# Altium project ads129x_Demoboard.PrjPcb
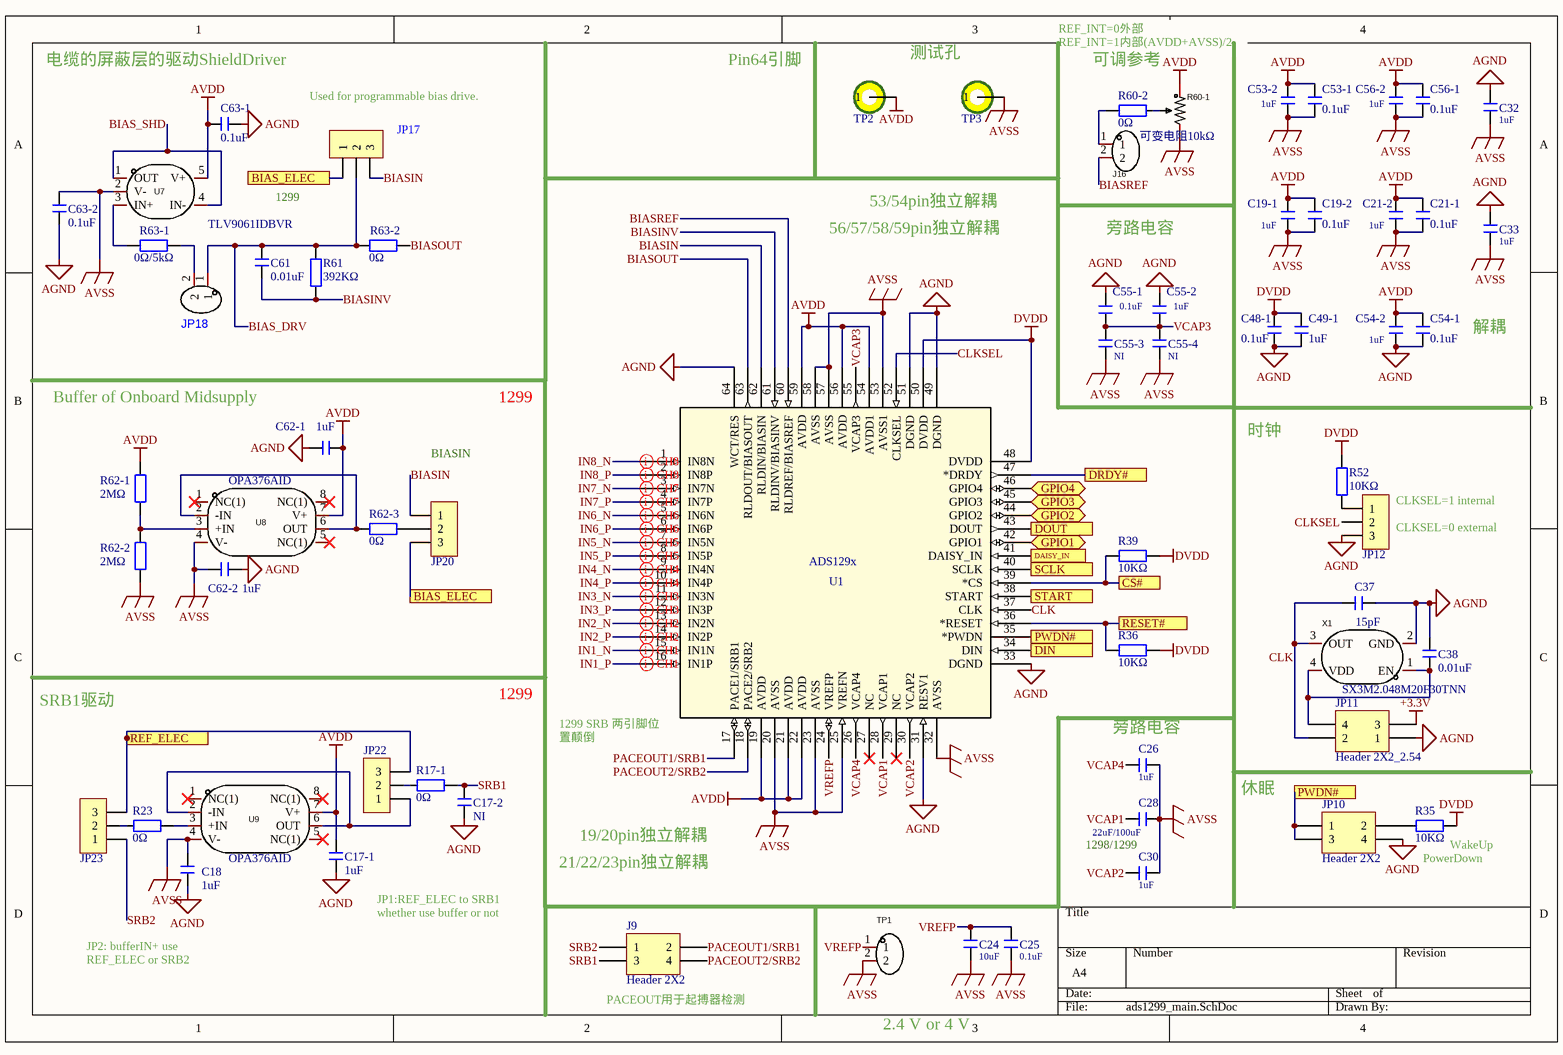
[diagram p0: ads1299_main.SchDoc]
4 sheets, 175 parts. Net scope: global (net labels, ports and power ports of the same name join across sheets).
Board file: ads1299.PcbDoc
Sheets:
  ads1299_main.SchDoc
  ads1299_Regulators.SchDoc
  ads1299_Ain.SchDoc
  ads1299_Interface.SchDoc

## Sheet ads1299_main.SchDoc
size A4

### Parts
C17-1  1uF  [0603C]
C17-2  NI  [0603C]
C18  1uF  [0603C]
C19-1  1uF  [0603C]
C19-2  0.1uF  [0603C]
C21-1  0.1uF  [0603C]
C21-2  1uF  [0603C]
C24  10uF  [0603C]
C25  0.1uF  [0603C]
C26  1uF  [0603C]
C28  22uF/100uF  [0603C]
C30  1uF  [0603C]
C32  1uF  [0603C]
C33  1uF  [0603C]
C37  15pF  [0603C]
C38  0.01uF  [0603C]
C48-1  0.1uF  [0603C]
C49-1  1uF  [0603C]
C53-1  0.1uF  [0603C]
C53-2  1uF  [0603C]
C54-1  0.1uF  [0603C]
C54-2  1uF  [0603C]
C55-1  0.1uF  [0603C]
C55-2  1uF  [0603C]
C55-3  NI  [0603C]
C55-4  NI  [0603C]
C56-1  0.1uF  [0603C]
C56-2  1uF  [0603C]
C61  0.01uF  [0603C]
C62-1  1uF  [0603C]
C62-2  1uF  [0603C]
C63-1  0.1uF  [0603C]
C63-2  0.1uF  [0603C]
J9  Header 2X2  [HDR2.54-LI-2x2P]
J16  Header_2P_2.54  [HDR2.54-LI-2P]  (value not drawn)
JP10  Header 2X2  [HDR2.54-LI-2x2P]
JP11  Header 2X2_2.54  [HDR2.54-LI-2x2P]
JP12  HDR-1X3  [HDR2.54-LI-3P]  (value not drawn)
JP17  HDR-1X3  [HDR2.54-LI-3P]  (value not drawn)
JP18  Header_2P_2.54  [HDR2.54-LI-2P]  (value not drawn)
JP20  HDR-1X3  [HDR2.54-LI-3P]  (value not drawn)
JP22  HDR-1X3  [HDR2.54-LI-3P]  (value not drawn)
JP23  HDR-1X3  [HDR2.54-LI-3P]  (value not drawn)
R17-1  0Ω  [0603R]
R23  0Ω  [0603R]
R35  10KΩ  [0603R]
R36  10KΩ  [0603R]
R39  10KΩ  [0603R]
R52  10KΩ  [0603R]
R60-1  可变电阻10kΩ  [RES-ADJ-TH_3362P]
R60-2  0Ω  [0603R]
R61  392KΩ  [0603R]
R62-1  2MΩ  [0603R]
R62-2  2MΩ  [0603R]
R62-3  0Ω  [0603R]
R63-1  0Ω/5kΩ  [0603R]
R63-2  0Ω  [0603R]
TP1  Header_2P_2.54  [HDR2.54-LI-2P]  (value not drawn)
TP2  测试点  [TestPoint_Pad]  (value not drawn)
TP3  测试点  [TestPoint_Pad]  (value not drawn)
U1  ADS129x  [LQFP-64]
U7  TLV9061IDBVR  [SOT23-5]
U8  OPA376AID  [SOIC-8]
U9  OPA376AID  [SOIC-8]
X1  SX3M2.048M20F30TNN  [OSC 3225-4P]

### Ports
BIAS_ELEC, CS#, DAISY_IN, DIN, DOUT, DRDY#, GPIO1 (bidir), GPIO2 (bidir), GPIO3 (bidir), GPIO4 (bidir), PWDN#, REF_ELEC, RESET#, SCLK, START

### Nets
+3.3V: JP11.3
AGND: C17-1.1 C17-2.1 C18.2 C32.1 C33.1 C37.1 C38.2 C48-1.1 C49-1.1 C54-1.1 C54-2.1 C55-1.1 C55-2.1 C62-1.1 C62-2.2 C63-1.1 C63-2.2 JP10.4 JP11.1 JP12.3 U1.31(RESV1) U1.33(DGND) U1.49(DGND) U1.51(DGND) U1.64(WCT/RES) X1.2(GND)
AVDD: C17-1.2 C19-1.2 C19-2.2 C21-1.2 C21-2.2 C53-1.2 C53-2.2 C54-1.2 C54-2.2 C56-1.2 C56-2.2 C62-1.2 C63-1.2 R60-1.1 R62-1.2 TP2.1 U1.19(AVDD) U1.21(AVDD) U1.22(AVDD) U1.54(AVDD1) U1.56(AVDD) U1.59(AVDD) U7.5(V+) U8.7(V+) U9.7(V+)
AVSS: C18.1 C19-1.1 C19-2.1 C21-1.1 C21-2.1 C24.2 C25.1 C26.1 C28.1 C30.1 C32.2 C33.2 C53-1.1 C53-2.1 C55-3.2 C55-4.2 C56-1.1 C56-2.1 C62-2.1 C63-2.1 R60-1.3 R62-2.1 TP1.2 TP3.1 U1.20(AVSS) U1.23(AVSS) U1.25(VREFN) U1.32(AVSS) U1.53(AVSS1) U1.57(AVSS) U1.58(AVSS) U7.2(V-) U8.4(V-) U9.4(V-)
DVDD: C48-1.2 C49-1.2 R35.1 R36.2 R39.1 R52.2 U1.48(DVDD) U1.50(DVDD)
BIAS_DRV: C61.1 JP17.2 JP18.1 R61.2 R63-2.2
BIAS_ELEC: JP17.1 JP20.3 ; port BIAS_ELEC
BIAS_SHD: U7.1(OUT) U7.4(IN-)
BIASIN: JP17.3 JP20.1 U1.62(RLDIN/BIASIN)
BIASINV: C61.2 R61.1 U1.61(RLDINV/BIASINV)
BIASOUT: R63-2.1 U1.63(RLDOUT/BIASOUT)
BIASREF: J16.2 U1.60(RLDREF/BIASREF)
CLK: C37.2 JP11.2 U1.37(CLK) X1.3(OUT)
CLKSEL: JP12.2 U1.52(CLKSEL)
CS#: R39.2 U1.39(*CS) ; port CS#
DAISY_IN: U1.41(DAISY_IN) ; port DAISY_IN
DIN: U1.34(DIN) ; port DIN
DOUT: U1.43(DOUT) ; port DOUT
DRDY#: U1.47(*DRDY) ; port DRDY#
GPIO1: U1.42(GPIO1) ; port GPIO1
GPIO2: U1.44(GPIO2) ; port GPIO2
GPIO3: U1.45(GPIO3) ; port GPIO3
GPIO4: U1.46(GPIO4) ; port GPIO4
IN1_N: U1.15(IN1N)
IN1_P: U1.16(IN1P)
IN2_N: U1.13(IN2N)
IN2_P: U1.14(IN2P)
IN3_N: U1.11(IN3N)
IN3_P: U1.12(IN3P)
IN4_N: U1.9(IN4N)
IN4_P: U1.10(IN4P)
IN5_N: U1.7(IN5N)
IN5_P: U1.8(IN5P)
IN6_N: U1.5(IN6N)
IN6_P: U1.6(IN6P)
IN7_N: U1.3(IN7N)
IN7_P: U1.4(IN7P)
IN8_N: U1.1(IN8N)
IN8_P: U1.2(IN8P)
PACEOUT1/SRB1: J9.2 U1.17(PACE1/SRB1)
PACEOUT2/SRB2: J9.4 U1.18(PACE2/SRB2)
PWDN#: JP10.1 JP10.3 U1.35(*PWDN) ; port PWDN#
REF_ELEC: JP22.3 JP23.3 ; port REF_ELEC
RESET#: R36.1 U1.36(*RESET) ; port RESET#
SCLK: U1.40(SCLK) ; port SCLK
SRB1: C17-2.2 J9.3 R17-1.2
SRB2: J9.1 JP23.1
START: U1.38(START) ; port START
VCAP1: C28.2 U1.28(VCAP1)
VCAP2: C30.2 U1.30(VCAP2)
VCAP3: C55-1.2 C55-2.2 C55-3.1 C55-4.1 U1.55(VCAP3)
VCAP4: C26.2 U1.26(VCAP4)
VREFP: C24.1 C25.2 TP1.1 U1.24(VREFP)
NetC38_1: C38.1 JP11.4 X1.1(EN) X1.4(VDD)
NetJ16_1: J16.1 R60-2.2
NetJP10_2: JP10.2 R35.2
NetJP12_1: JP12.1 R52.1
NetJP18_2: JP18.2 R63-1.2
NetJP20_2: JP20.2 R62-3.2
NetJP22_1: JP22.1 U9.2(-IN) U9.6(OUT)
NetJP22_2: JP22.2 R17-1.1
NetJP23_2: JP23.2 R23.1
NetR23_2: R23.2 U9.3(+IN)
NetR60-1_2: R60-1.2 R60-2.1
NetR62-1_1: R62-1.1 R62-2.2 U8.3(+IN)
NetR62-3_1: R62-3.1 U8.2(-IN) U8.6(OUT)
NetR63-1_1: R63-1.1 U7.3(IN+)

Not connected (* = marked no-connect by the designer): U1 27(NC)* 29(NC)*; U8 1(NC(1))* 5(NC(1))* 8(NC(1))*; U9 1(NC(1))* 5(NC(1))* 8(NC(1))*

### Layout directives
differential pair: IN1_N, IN1_P, IN2_N, IN2_P, IN3_N, IN3_P, IN4_N, IN4_P, IN5_N, IN5_P, IN6_N, IN6_P, IN7_N, IN7_P, IN8_N, IN8_P

### Notes on the sheet
- REF_INT=0外部
  REF_INT=1内部(AVDD+AVSS)/2
- 电缆的屏蔽层的驱动ShieldDriver
- Used for programmable bias drive.
- Pin64引脚
- 测试孔
- 可调参考
- 1299
- 56/57/58/59pin独立解耦
- 53/54pin独立解耦
- 旁路电容
- 解耦
- Buffer of Onboard Midsupply
- BIASIN
- 时钟
- (near JP12) CLKSEL=0 external
- CLKSEL=1 internal
- SRB1驱动
- (near U1) 1299 SRB 两引脚位置颠倒
- (near C26) 旁路电容
- 休眠
- 19/20pin独立解耦
- 1298/1299
- (near R35) PowerDown
- (near R35) WakeUp
- (near C17-1) JP1:REF_ELEC to SRB1
  whether use buffer or not
- 21/22/23pin独立解耦
- JP2: bufferIN+ use
  REF_ELEC or SRB2
- (near J9) PACEOUT用于起搏器检测
- 2.4 V or 4 V

### Library data of the parts
C17-1 C17-2 C18 C19-1 C19-2 C21-1 C21-2 C24-C26 C28 C30 C32 C33 C37 C38 C48-1 C49-1 C53-1 C53-2 C54-1 C54-2 C55-1-C55-4 C56-1 C56-2 C61 C62-1 C62-2 C63-1 C63-2 = C: Chip  Ceramic Capacitor; BOM名称: 无极性贴片电容; 版权归属: 源创客; 学习资源: www.ooocke.com
J9 JP10 = Header 2X2: Header, 2-Pin, Dual row; LatestRevisionDate: 17-Jul-2002; LatestRevisionNote: Re-released for DXP Platform.; Publisher: Altium Limited
J16 JP18 TP1 = Header_2P_2.54: Manufacturer: MOLEX; Name: 22284020; Add into BOM: yes; Pitch: 2.54mm; Pin Structure: 1x2P; Circluar Pins/Square Pins: 方针; Symbol: 22-28-4020; Device: 22284020; LCSC Part Name: 2.54mm 1x2P 直插 方针; Supplier Part: C234182; Manufacturer Part: 22284020; Supplier Footprint: 直插,P=2.54mm; JLCPCB Part Class: Extended Part; Datasheet: https://atta.szlcsc.com/upload/public/pdf/source/20180801/C234182_F77B1C2A9EF8AC9B34CEB7670B45930E.pdf; Supplier: LCSC; Convert to PCB: yes; Number of Pins: 2; Number of Rows: 1; Row Spacing: -; Mounting Type: 直插; Current Rating (Max): -; Voltage Rating (Max): -; Length of Mating Pin: -; Insulation Height: -; Contact Material: 黄铜; Contact Plating: -; Color: 黑色
JP11 = Header 2X2_2.54: Header, 2-Pin, Dual row; LatestRevisionDate: 17-Jul-2002; LatestRevisionNote: Re-released for DXP Platform.; Publisher: Altium Limited
JP12 JP17 JP20 JP22 JP23 = Header 3: 3P接插件; 版权归属: 源创客; BOM名称: 3P接插件; 学习资源: www.ooocke.com
R17-1 R23 R35 R36 R39 R52 R60-2 R61 R62-1-R62-3 R63-1 R63-2 = R: 贴片电阻; 版权归属: 源创客; BOM名称: 贴片电阻; 学习资源: www.ooocke.com
R60-1 = 3362P-1-103: Manufacturer: BOCHEN(博晨); Name: 10kΩ; Symbol: 3362P-1-103_C118956; Add into BOM: yes; Value: 10kΩ; Tolerance: ±10%; Device: 3362P-1-103; LCSC Part Name: 10kΩ ±10%; Supplier Part: C118956; Manufacturer Part: 3362P-1-103; Supplier Footprint: 插件; JLCPCB Part Class: Extended Part; Datasheet: https://atta.szlcsc.com/upload/public/pdf/source/20171114/C118956_15106326650691117445.pdf; Supplier: LCSC; Convert to PCB: yes
TP2 TP3 = TestPoint
U1 = ADS129x: ECG,EEG; Mfr_Name: Texas Instruments; Manufacturer_Part_Number: ADS131E08SPAG; Copyright: Copyright (C) 2022 Ultra Librarian. All rights reserved.; RefDes: RefDes; Type: DEV
U7 = TLV9061IDBVR: Manufacturer: TI(德州仪器); Add into BOM: yes; Name: TLV9061IDBVR; Symbol: TLV9061IDBVR; Device: TLV9061IDBVR; LCSC Part Name: TLV9061IDBVR; Supplier Part: C398358; Manufacturer Part: TLV9061IDBVR; Supplier Footprint: SOT-23-5; JLCPCB Part Class: Extended Part; Datasheet: https://atta.szlcsc.com/upload/public/pdf/source/20190614/C398358_49FE9762020E71441728160F646E231F.pdf; Supplier: LCSC; Convert to PCB: yes; Amplifier Type: -; Number of Circuits: -; -3db Bandwidth（G=1）: -; Current - Input Bias（Ib）: -; Voltage - Input Offset（Vos）: -; Gain Bandwidth Product（GBP）: -; Slew Rate（SR）: -; Output Type: -; Supply Voltage（Single）: -; Iq per channel (Typ): -; Operating Temperature: -
U8 U9 = OPA376AID: Manufacturer: TI(德州仪器); Add into BOM: yes; Name: OPA376AID; Symbol: OPA376AID; Device: OPA376AID; LCSC Part Name: OPA376AID; Supplier Part: C1347528; Manufacturer Part: OPA376AID; Supplier Footprint: SOIC-8; JLCPCB Part Class: Extended Part; Datasheet: https://atta.szlcsc.com/upload/public/pdf/source/20210701/9FC12D00E1332600214DE3C63939EFF5.pdf; Supplier: LCSC; Convert to PCB: yes
X1 = SX3M2.048M20F30TNN: Manufacturer: SCTF(星通时频); Name: 2.048MHz; Add into BOM: yes; Value: 2.048MHz; Frequency Stability: ±20ppm; Supply Voltage: 1.62V~3.63V; Supply Current (Max): 10mA; Output Type: CMOS; Symbol: SX3M2.048M20F30TNN; Device: SX3M2.048M20F30TNN; LCSC Part Name: 2.048MHz ±20ppm 1.62V~3.63V CMOS; Supplier Part: C2901549; Manufacturer Part: SX3M2.048M20F30TNN; Supplier Footprint: SMD3225-4P; JLCPCB Part Class: Extended Part; Datasheet: https://atta.szlcsc.com/upload/public/pdf/source/20211009/2941C931EA31459006A6A1B668A18381.pdf; Supplier: LCSC; Convert to PCB: yes; Operating Temperature: -40℃~+85℃

## Sheet ads1299_Regulators.SchDoc
size A4
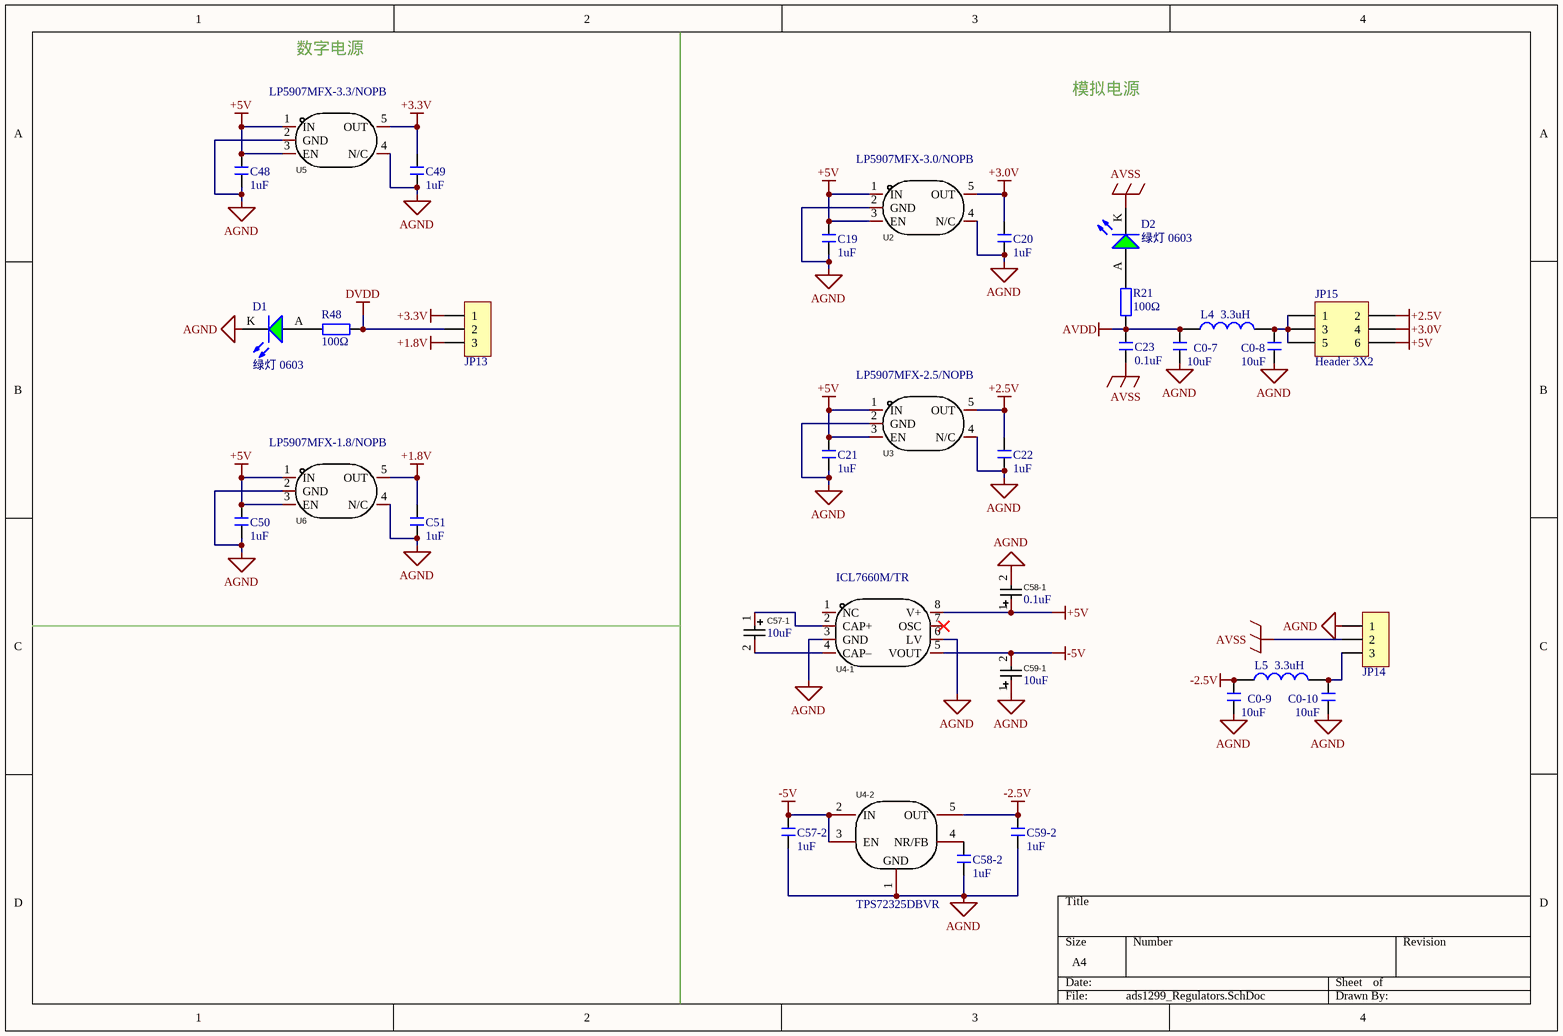
[diagram p1: ads1299_Regulators.SchDoc]

### Parts
C0-7  10uF  [0603C]
C0-8  10uF  [0603C]
C0-9  10uF  [0603C]
C0-10  10uF  [0603C]
C19  1uF  [0603C]
C20  1uF  [0603C]
C21  1uF  [0603C]
C22  1uF  [0603C]
C23  0.1uF  [0603C]
C48  1uF  [0603C]
C49  1uF  [0603C]
C50  1uF  [0603C]
C51  1uF  [0603C]
C57-1  10uF  [Tantalum_cap]
C57-2  1uF  [0603C]
C58-1  0.1uF  [Tantalum_cap]
C58-2  1uF  [0603C]
C59-1  10uF  [Tantalum_cap]
C59-2  1uF  [0603C]
D1  绿灯 0603  [LED 0603G]
D2  绿灯 0603  [LED 0603G]
JP13  HDR-1X3  [HDR2.54-LI-3P]  (value not drawn)
JP14  HDR-1X3  [HDR2.54-LI-3P]  (value not drawn)
JP15  Header 3X2  [HDR2.54-LI-2x3P]
L4  3.3uH  [L 1206]
L5  3.3uH  [L 1206]
R21  100Ω  [0603R]
R48  100Ω  [0603R]
U2  LP5907MFX-3.0/NOPB  [SOT23-5]
U3  LP5907MFX-2.5/NOPB  [SOT23-5]
U4-1  ICL7660M/TR  [SOIC-8]
U4-2  TPS72325DBVR  [SOT23-5]
U5  LP5907MFX-3.3/NOPB  [SOT23-5]
U6  LP5907MFX-1.8/NOPB  [SOT23-5]

### Nets
+1.8V: C51.2 JP13.3 U6.5(OUT)
+2.5V: C22.2 JP15.2 U3.5(OUT)
+3.0V: C20.2 JP15.4 U2.5(OUT)
+3.3V: C49.2 JP13.1 U5.5(OUT)
+5V: C19.2 C21.2 C48.2 C50.2 C58-1.1 JP15.6 U2.1(IN) U2.3(EN) U3.1(IN) U3.3(EN) U4-1.8(V+) U5.1(IN) U5.3(EN) U6.1(IN) U6.3(EN)
-2.5V: C0-9.2 C59-2.2 L5.1 U4-2.5(OUT)
-5V: C57-2.2 C59-1.2 U4-1.5(VOUT) U4-2.2(IN) U4-2.3(EN)
AGND: C0-7.1 C0-8.1 C0-9.1 C0-10.1 C19.1 C20.1 C21.1 C22.1 C48.1 C49.1 C50.1 C51.1 C57-2.1 C58-1.2 C58-2.1 C59-1.1 C59-2.1 D1.K JP14.1 U2.2(GND) U2.4(N/C) U3.2(GND) U3.4(N/C) U4-1.3(GND) U4-1.6(LV) U4-2.1(GND) U5.2(GND) U5.4(N/C) U6.2(GND) U6.4(N/C)
AVDD: C0-7.2 C23.2 L4.1 R21.2
AVSS: C23.1 D2.K JP14.2
DVDD: JP13.2 R48.2
NetC0-8_2: C0-8.2 JP15.1 JP15.3 JP15.5 L4.2
NetC0-10_2: C0-10.2 JP14.3 L5.2
NetC57-1_1: C57-1.1 U4-1.2(CAP+)
NetC57-1_2: C57-1.2 U4-1.4(CAP–)
NetC58-2_2: C58-2.2 U4-2.4(NR/FB)
NetD1_A: D1.A R48.1
NetD2_A: D2.A R21.1

Not connected (* = marked no-connect by the designer): U4-1 1(NC) 7(OSC)*

### Notes on the sheet
- 数字电源
- 模拟电源

### Library data of the parts
C0-7-C0-10 C19-C23 C48-C51 C57-2 C58-2 C59-2 = C: as C17-1 on sheet ads1299_main; 学习资源: www.ooocke.com
C57-1 C58-1 C59-1 = Tantalum_cap: Manufacturer: Kyocera AVX; Name: 1uF; Symbol: TAJA105K035RNJ; Add into BOM: yes; Value: 1uF; Tolerance: ±10%; Rated Voltage: 35V; Equivalent Series Resistance(ESR): 7.5Ω@100kHz; Device: TAJA105K035RNJ; LCSC Part Name: 1uF ±10% 35V; Supplier Part: C7176; Manufacturer Part: TAJA105K035RNJ; Supplier Footprint: CASE-A_3216; JLCPCB Part Class: Extended Part; Datasheet: https://atta.szlcsc.com/upload/public/pdf/source/20160107/1457707748301.pdf; Supplier: LCSC; Convert to PCB: yes; Operating Temperature: -55℃~+125℃
D1 D2 = 0603 绿灯: 发光二极管; ComponentLink1Description: 供应商链接; ComponentLink1URL: http://www.szlcsc.com/product/details_73152.html; Package: 0603; Supplier: LC; SuppliersPartNumber: C72043
JP13 JP14 = Header 3: 3P接插件; 版权归属: 源创客; BOM名称: 3P接插件; 学习资源: www.ooocke.com
JP15 = Header 3X2: Header, 3-Pin, Dual row; LatestRevisionDate: 17-Jul-2002; LatestRevisionNote: Re-released for DXP Platform.; Publisher: Altium Limited
L4 L5 = L 1206: 小功率贴片电感; 版权归属: 源创客; BOM名称: 小功率贴片电感; 学习资源: www.ooocke.com
R21 R48 = R: 贴片电阻; 版权归属: 源创客; BOM名称: 贴片电阻; 学习资源: www.ooocke.com
U2 U3 U5 U6 = LP5907MFX-3.3/NOPB: Manufacturer: TI(德州仪器); Add into BOM: yes; Output Type: 固定; Output Polarity: 正; Number of Outputs: 1; Maximum Input Voltage: 5.5V; Output Voltage: 3.3V; Dropout Voltage: 250mV@(250mA); Output Current: 250mA; Power Supply Rejection Ratio (PRSS): 90dB@(100Hz),60dB@(100kHz); Name: LP5907MFX-3.3/NOPB; Symbol: LP5907MFX-3.3/NOPB; Device: LP5907MFX-3.3/NOPB; LCSC Part Name: Vin=5.5V Vout=3.3V 250mA 90dB@(100Hz),60dB@(100kHz); Supplier Part: C80670; Manufacturer Part: LP5907MFX-3.3/NOPB; Supplier Footprint: SOT-23-5; JLCPCB Part Class: Extended Part; Datasheet: https://atta.szlcsc.com/upload/public/pdf/source/20160830/1472551528598.pdf; Supplier: LCSC; Convert to PCB: yes
U4-1 = ICL7660M/TR: Manufacturer: HGSEMI(华冠); Add into BOM: yes; Name: ICL7660M/TR; Symbol: ICL7660M/TR; Device: ICL7660M/TR; LCSC Part Name: ICL7660M/TR; Supplier Part: C356724; Manufacturer Part: ICL7660M/TR; Supplier Footprint: SOP-8; JLCPCB Part Class: Extended Part; Datasheet: https://atta.szlcsc.com/upload/public/pdf/source/20220223/B7DC69E53F1DD57A8AF8717E7604F527.pdf; Supplier: LCSC; Convert to PCB: yes
U4-2 = TPS72325DBVR: Manufacturer: TI(德州仪器); Add into BOM: yes; Output Type: 固定; Output Polarity: 负; Number of Outputs: 1; Maximum Input Voltage: 10V; Output Voltage: 2.5V; Dropout Voltage: 500mV@(200mA); Output Current: 200mA; Power Supply Rejection Ratio (PSRR): 65dB; Name: TPS72325DBVR; Symbol: TPS72325DBVR; Device: TPS72325DBVR; LCSC Part Name: 负 Vin=10V Vout=2.5V 200mA 65dB; Supplier Part: C69932; Manufacturer Part: TPS72325DBVR; Supplier Footprint: SOT-23-5; JLCPCB Part Class: Extended Part; Datasheet: https://atta.szlcsc.com/upload/public/pdf/source/20171113/C69932_15105675558771116637.pdf; Supplier: LCSC; Convert to PCB: yes

## Sheet ads1299_Ain.SchDoc
size A4
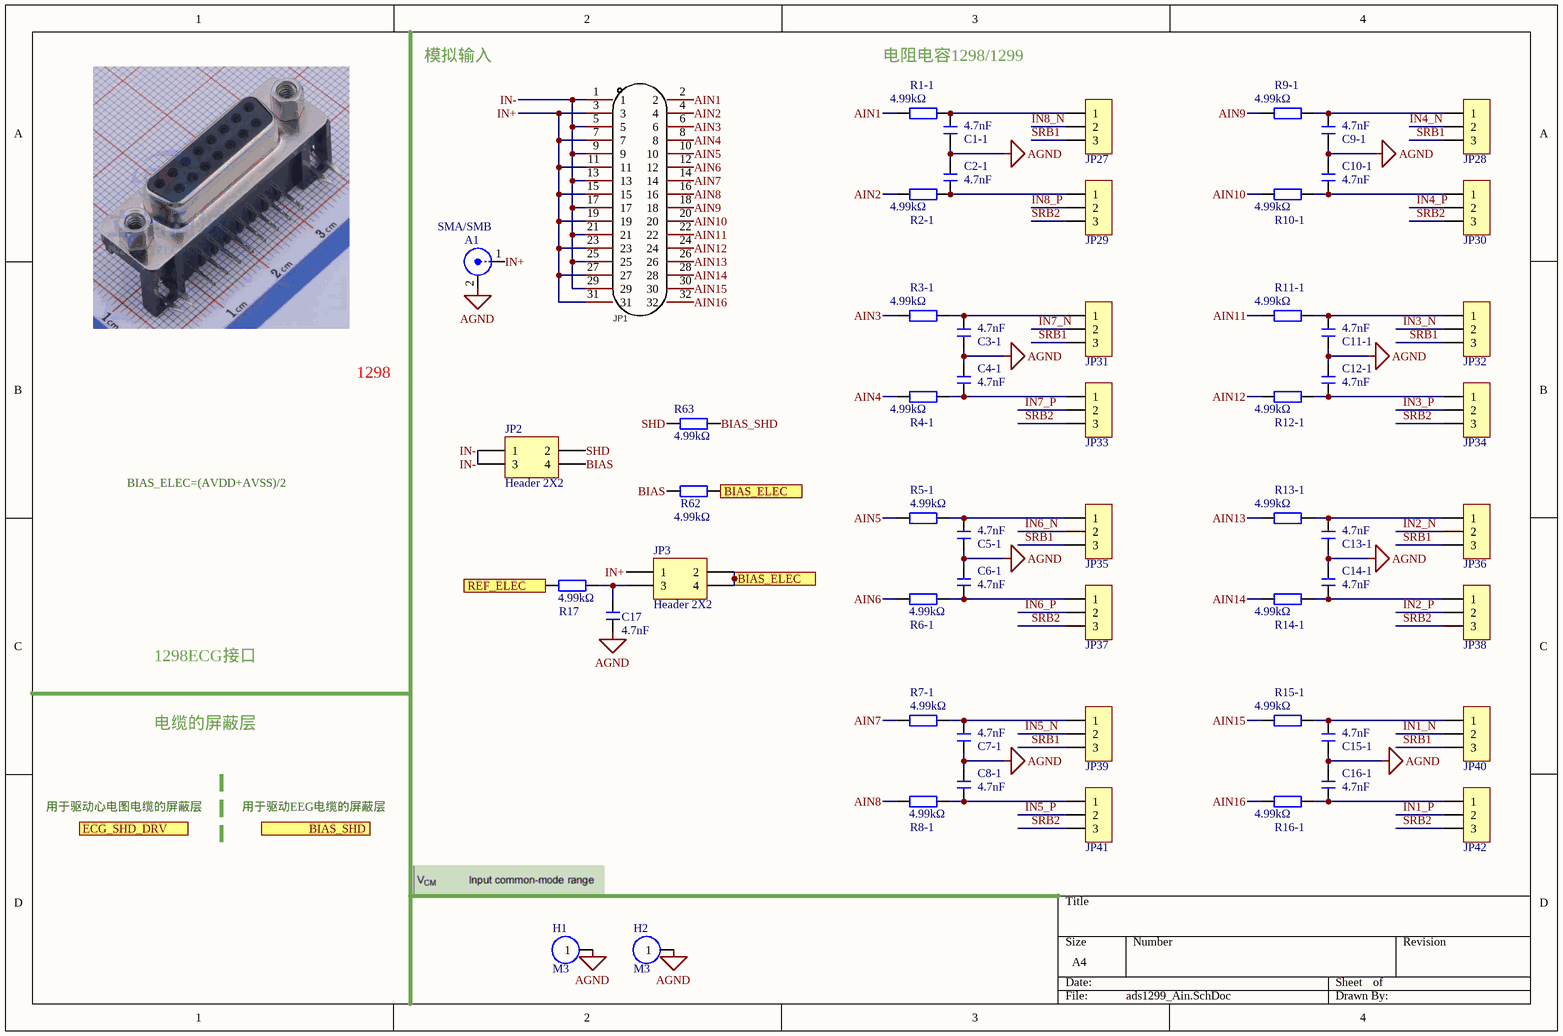
[diagram p2: ads1299_Ain.SchDoc]

### Parts
A1  SMA/SMB  [SMB_V-RJ45]
C1-1  4.7nF  [0603C]
C2-1  4.7nF  [0603C]
C3-1  4.7nF  [0603C]
C4-1  4.7nF  [0603C]
C5-1  4.7nF  [0603C]
C6-1  4.7nF  [0603C]
C7-1  4.7nF  [0603C]
C8-1  4.7nF  [0603C]
C9-1  4.7nF  [0603C]
C10-1  4.7nF  [0603C]
C11-1  4.7nF  [0603C]
C12-1  4.7nF  [0603C]
C13-1  4.7nF  [0603C]
C14-1  4.7nF  [0603C]
C15-1  4.7nF  [0603C]
C16-1  4.7nF  [0603C]
C17  4.7nF  [0603C]
H1  M3  [M3x4_L]
H2  M3  [M3x4_L]
JP1  B-2100S32P-B110  [HDR-TH_32P-P2.54-V-M-R2-C16-S2.54]  (value not drawn)
JP2  Header 2X2  [HDR2.54-LI-2x2P]
JP3  Header 2X2  [HDR2.54-LI-2x2P]
JP27  HDR-1X3  [HDR2.54-LI-3P]  (value not drawn)
JP28  HDR-1X3  [HDR2.54-LI-3P]  (value not drawn)
JP29  HDR-1X3  [HDR2.54-LI-3P]  (value not drawn)
JP30  HDR-1X3  [HDR2.54-LI-3P]  (value not drawn)
JP31  HDR-1X3  [HDR2.54-LI-3P]  (value not drawn)
JP32  HDR-1X3  [HDR2.54-LI-3P]  (value not drawn)
JP33  HDR-1X3  [HDR2.54-LI-3P]  (value not drawn)
JP34  HDR-1X3  [HDR2.54-LI-3P]  (value not drawn)
JP35  HDR-1X3  [HDR2.54-LI-3P]  (value not drawn)
JP36  HDR-1X3  [HDR2.54-LI-3P]  (value not drawn)
JP37  HDR-1X3  [HDR2.54-LI-3P]  (value not drawn)
JP38  HDR-1X3  [HDR2.54-LI-3P]  (value not drawn)
JP39  HDR-1X3  [HDR2.54-LI-3P]  (value not drawn)
JP40  HDR-1X3  [HDR2.54-LI-3P]  (value not drawn)
JP41  HDR-1X3  [HDR2.54-LI-3P]  (value not drawn)
JP42  HDR-1X3  [HDR2.54-LI-3P]  (value not drawn)
R1-1  4.99kΩ  [0603R]
R2-1  4.99kΩ  [0603R]
R3-1  4.99kΩ  [0603R]
R4-1  4.99kΩ  [0603R]
R5-1  4.99kΩ  [0603R]
R6-1  4.99kΩ  [0603R]
R7-1  4.99kΩ  [0603R]
R8-1  4.99kΩ  [0603R]
R9-1  4.99kΩ  [0603R]
R10-1  4.99kΩ  [0603R]
R11-1  4.99kΩ  [0603R]
R12-1  4.99kΩ  [0603R]
R13-1  4.99kΩ  [0603R]
R14-1  4.99kΩ  [0603R]
R15-1  4.99kΩ  [0603R]
R16-1  4.99kΩ  [0603R]
R17  4.99kΩ  [0603R]
R62  4.99kΩ  [0603R]
R63  4.99kΩ  [0603R]

### Ports
BIAS_ELEC, BIAS_SHD, ECG_SHD_DRV, REF_ELEC

### Nets
AGND: A1.2(Y) C1-1.1 C2-1.2 C3-1.1 C4-1.2 C5-1.1 C6-1.2 C7-1.1 C8-1.2 C9-1.1 C10-1.2 C11-1.1 C12-1.2 C13-1.1 C14-1.2 C15-1.1 C16-1.2 C17.1 H1.1 H2.1
AIN1: JP1.2 R1-1.1
AIN2: JP1.4 R2-1.1
AIN3: JP1.6 R3-1.1
AIN4: JP1.8 R4-1.1
AIN5: JP1.10 R5-1.1
AIN6: JP1.12 R6-1.1
AIN7: JP1.14 R7-1.1
AIN8: JP1.16 R8-1.1
AIN9: JP1.18 R9-1.1
AIN10: JP1.20 R10-1.1
AIN11: JP1.22 R11-1.1
AIN12: JP1.24 R12-1.1
AIN13: JP1.26 R13-1.1
AIN14: JP1.28 R14-1.1
AIN15: JP1.30 R15-1.1
AIN16: JP1.32 R16-1.1
BIAS: JP2.4 R62.1
BIAS_ELEC: JP3.2 JP3.4 R62.2 ; port BIAS_ELEC
BIAS_SHD: R63.2
IN1_N: JP40.2
IN1_P: JP42.2
IN2_N: JP36.2
IN2_P: JP38.2
IN3_N: JP32.2
IN3_P: JP34.2
IN4_N: JP28.2
IN4_P: JP30.2
IN5_N: JP39.2
IN5_P: JP41.2
IN6_N: JP35.2
IN6_P: JP37.2
IN7_N: JP31.2
IN7_P: JP33.2
IN8_N: JP27.2
IN8_P: JP29.2
IN+: A1.1(X) JP1.3 JP1.7 JP1.11 JP1.15 JP1.19 JP1.23 JP1.27 JP1.31 JP3.1
IN-: JP1.1 JP1.5 JP1.9 JP1.13 JP1.17 JP1.21 JP1.25 JP1.29 JP2.1 JP2.3
REF_ELEC: R17.1 ; port REF_ELEC
SHD: JP2.2 R63.1
SRB1: JP27.3 JP28.3 JP31.3 JP32.3 JP35.3 JP36.3 JP39.3 JP40.3
SRB2: JP29.3 JP30.3 JP33.3 JP34.3 JP37.3 JP38.3 JP41.3 JP42.3
NetC1-1_2: C1-1.2 JP27.1 R1-1.2
NetC2-1_1: C2-1.1 JP29.1 R2-1.2
NetC3-1_2: C3-1.2 JP31.1 R3-1.2
NetC4-1_1: C4-1.1 JP33.1 R4-1.2
NetC5-1_2: C5-1.2 JP35.1 R5-1.2
NetC6-1_1: C6-1.1 JP37.1 R6-1.2
NetC7-1_2: C7-1.2 JP39.1 R7-1.2
NetC8-1_1: C8-1.1 JP41.1 R8-1.2
NetC9-1_2: C9-1.2 JP28.1 R9-1.2
NetC10-1_1: C10-1.1 JP30.1 R10-1.2
NetC11-1_2: C11-1.2 JP32.1 R11-1.2
NetC12-1_1: C12-1.1 JP34.1 R12-1.2
NetC13-1_2: C13-1.2 JP36.1 R13-1.2
NetC14-1_1: C14-1.1 JP38.1 R14-1.2
NetC15-1_2: C15-1.2 JP40.1 R15-1.2
NetC16-1_1: C16-1.1 JP42.1 R16-1.2
NetC17_2: C17.2 JP3.3 R17.2

### Notes on the sheet
- 模拟输入
- 电阻电容1298/1299
- 1298
- BIAS_ELEC=(AVDD+AVSS)/2
- 1298ECG接口
- 电缆的屏蔽层
- 用于驱动心电图电缆的屏蔽层
- 用于驱动EEG电缆的屏蔽层

### Library data of the parts
A1 = SMB: SMB Straight Connector; LatestRevisionDate: 17-Jul-2002; LatestRevisionNote: Re-released for DXP Platform.; Publisher: Altium Limited
C1-1 C2-1 C3-1 C4-1 C5-1 C6-1 C7-1 C8-1 C9-1 C10-1 C11-1 C12-1 C13-1 C14-1 C15-1 C16-1 C17 = C: as C17-1 on sheet ads1299_main; 学习资源: www.ooocke.com
H1 H2 = M3: 铜柱孔; 版权归属: 封装库来自淘宝 ID：黄晶宝石; BOM名称: 铜柱孔; 学习资源: https://shop463601444.taobao.com
JP1 = Header2*16P: Manufacturer: Ckmtw(灿科盟); Symbol: 210S-2*16P L=11.6MMGold-plated black; Add into BOM: yes; Pitch: 2.54mm; Pin Structure: 2x16P; Name: B-2100S32P-B110; Device: B-2100S32P-B110; LCSC Part Name: 2.54mm 2x16P 直插; Supplier Part: C124382; Manufacturer Part: B-2100S32P-B110; Supplier Footprint: 直插,P=2.54mm; JLCPCB Part Class: Extended Part; Datasheet: https://atta.szlcsc.com/upload/public/pdf/source/20170821/C124382_1503303309726901536.pdf; Supplier: LCSC; Convert to PCB: yes; Number of Rows: 双排; Number of Pins: 32; Row Spacing: 2.54mm; Mounting Type: 直插; Circluar Pins/Square Pins: -; Current Rating (Max): -; Voltage Rating (Max): -; Length of Mating Pin: 6mm; Insulation Height: 2.54mm; Length of End Connection Pin: 3mm; Contact Material: 黄铜; Contact Plating: -; Operating Temperature Range: -40℃~+105℃; Color: 黑色
JP2 JP3 = Header 2X2: Header, 2-Pin, Dual row; LatestRevisionDate: 17-Jul-2002; LatestRevisionNote: Re-released for DXP Platform.; Publisher: Altium Limited
JP27-JP42 = Header 3: 3P接插件; 版权归属: 源创客; BOM名称: 3P接插件; 学习资源: www.ooocke.com
R1-1 R2-1 R3-1 R4-1 R5-1 R6-1 R7-1 R8-1 R9-1 R10-1 R11-1 R12-1 R13-1 R14-1 R15-1 R16-1 R17 R62 R63 = R: 贴片电阻; 版权归属: 源创客; BOM名称: 贴片电阻; 学习资源: www.ooocke.com

## Sheet ads1299_Interface.SchDoc
size A4
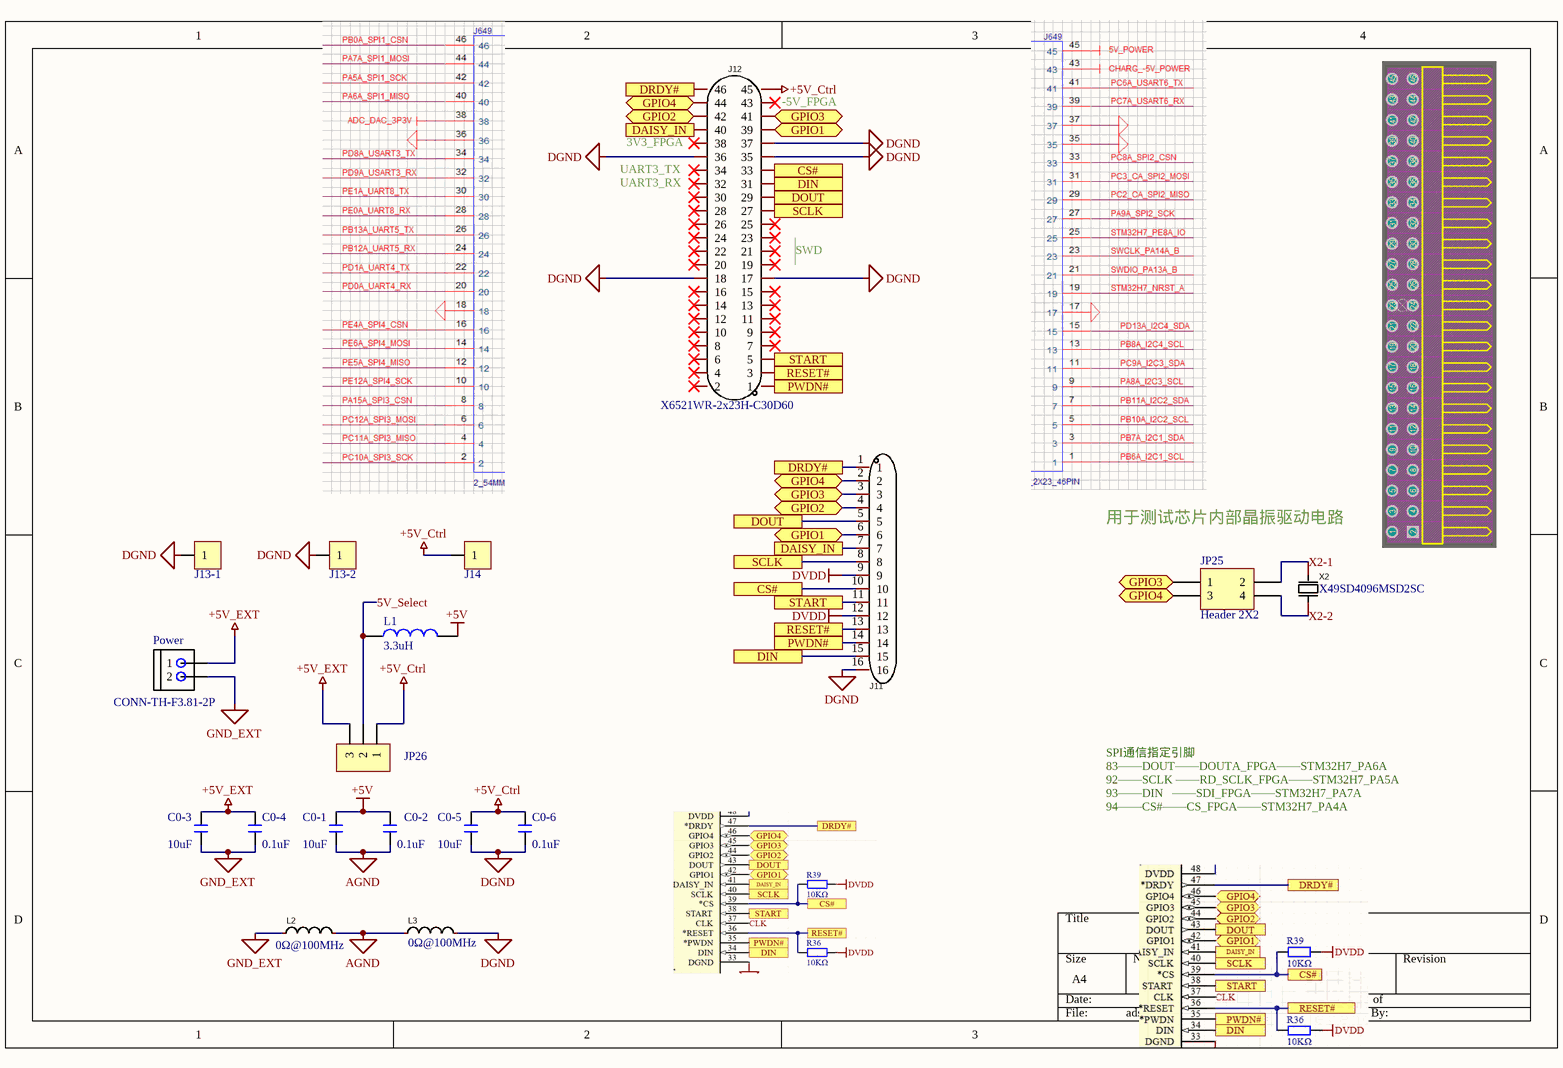
[diagram p3: ads1299_Interface.SchDoc]

### Parts
C0-1  10uF  [0603C]
C0-2  0.1uF  [0603C]
C0-3  10uF  [0603C]
C0-4  0.1uF  [0603C]
C0-5  10uF  [0603C]
C0-6  0.1uF  [0603C]
J11  KH-2.54PH180-1X16P-L11.5  [HDR-TH_16P-P2.54]  (value not drawn)
J12  X6521WR-2x23H-C30D60  [HDR-TH_2x23P-P2.54-Bent]
J13-1  Header_1P  [HDR-TH_1P]  (value not drawn)
J13-2  Header_1P  [HDR-TH_1P]  (value not drawn)
J14  Header_1P  [HDR-TH_1P]  (value not drawn)
JP25  Header 2X2  [HDR2.54-LI-2x2P]
JP26  HDR-1X3  [HDR2.54-LI-3P]  (value not drawn)
L1  3.3uH  [L 1206]
L2  0Ω@100MHz  [L 0603]
L3  0Ω@100MHz  [L 0603]
Power  CONN-TH-F3.81-2P  [CONN-TH_XY2500R-F-3.81-2P]
X2  X49SD4096MSD2SC  [HC-49US]

### Ports
CS#, DAISY_IN, DIN, DOUT, DRDY#, GPIO1 (bidir), GPIO2 (bidir), GPIO3 (bidir), GPIO4 (bidir), PWDN#, RESET#, SCLK, START

### Nets
+5V: C0-1.2 C0-2.2 L1.2
+5V_Ctrl: C0-5.2 C0-6.2 J12.45 J14.1 JP26.1
+5V_EXT: C0-3.2 C0-4.2 JP26.3 Power.1
AGND: C0-1.1 C0-2.1 L2.2 L3.1
DGND: C0-5.1 C0-6.1 J11.16 J12.17 J12.18 J12.35 J12.36 J12.37 J13-1.1 J13-2.1 L3.2
DVDD: J11.9 J11.12
GND_EXT: C0-3.1 C0-4.1 L2.1 Power.2
5V_Select: JP26.2 L1.1
CS#: J11.10 J12.33 ; port CS#
DAISY_IN: J11.7 J12.40 ; port DAISY_IN
DIN: J11.15 J12.31 ; port DIN
DOUT: J11.5 J12.29 ; port DOUT
DRDY#: J11.1 J12.46 ; port DRDY#
GPIO1: J11.6 J12.39 ; port GPIO1
GPIO2: J11.4 J12.42 ; port GPIO2
GPIO3: J11.3 J12.41 JP25.1 ; port GPIO3
GPIO4: J11.2 J12.44 JP25.3 ; port GPIO4
PWDN#: J11.14 J12.1 ; port PWDN#
RESET#: J11.13 J12.3 ; port RESET#
SCLK: J11.8 J12.27 ; port SCLK
START: J11.11 J12.5 ; port START
X2-1: JP25.2 X2.1(OSC1)
X2-2: JP25.4 X2.2(OSC2)

Not connected (* = marked no-connect by the designer): J12 2* 4* 6* 7* 8* 9* 10* 11* 12* 13* 14* 15* 16* 19* 20* 21* 22* 23* 24* 25* 26* 28* 30* 32* 34* 38* 43*

### Notes on the sheet
- (near J12) -5V_FPGA
- (near J12) UART3_RX
- (near J12) UART3_TX
- (near J12) 3V3_FPGA
- (near J12) SWD
- 用于测试芯片内部晶振驱动电路
- SPI通信指定引脚
  83——DOUT——DOUTA_FPGA——STM32H7_PA6A
  92——SCLK ——RD_SCLK_FPGA——STM32H7_PA5A
  93——DIN   ——SDI_FPGA——STM32H7_PA7A
  94——CS#——CS_FPGA——STM32H7_PA4A

### Library data of the parts
C0-1-C0-6 = C: as C17-1 on sheet ads1299_main; 学习资源: www.ooocke.com
J11 = Header1x16: Manufacturer: kinghelm(金航标); Add into BOM: yes; Pitch: 2.54mm; Pin Structure: 1x16P; Circluar Pins/Square Pins: 方针; Current Rating (Max): 3A; Name: KH-2.54PH180-1X16P-L11.5; Symbol: KH-2.54PH180-1X16P-L11.5; Device: KH-2.54PH180-1X16P-L11.5; LCSC Part Name: 2.54mm 1x16P 直插 方针; Supplier Part: C2905491; Manufacturer Part: KH-2.54PH180-1X16P-L11.5; Supplier Footprint: 直插,P=2.54mm; JLCPCB Part Class: Extended Part; Datasheet: https://atta.szlcsc.com/upload/public/pdf/source/20211019/0B04AAAEA732E66331FBDF3E5963EEAF.pdf; Supplier: LCSC; Convert to PCB: yes; Number of Rows: 单排; Number of Pins: 16; Row Spacing: -; Mounting Type: 直插; Voltage Rating (Max): -; Length of Mating Pin: 6mm; Insulation Height: 2.5mm; Length of End Connection Pin: 3mm; Contact Material: -; Operating Temperature Range: -40℃~+105℃; Color: 黑色
J12 = Header_2.54mm_2x23P_Bent: Manufacturer: XKB Connectivity(中国星坤); Symbol: X6521WR-2×23H-C30D60; Add into BOM: yes; Pitch: 2.54mm; Pin Structure: 2x23P; Circluar Pins/Square Pins: 方针; Current Rating (Max): 3A; Voltage Rating (Max): 250V; Welding Temperature (Max): 260℃; Name: X6521WR-2x23H-C30D60; Device: X6521WR-2x23H-C30D60; LCSC Part Name: 2.54mm 2x23P 弯插 方针 高镀金 抗氧化; Supplier Part: C725935; Manufacturer Part: X6521WR-2x23H-C30D60; Supplier Footprint: 弯插,P=2.54mm; JLCPCB Part Class: Extended Part; Datasheet: https://atta.szlcsc.com/upload/public/pdf/source/20211009/B321D35F509179B46434BAB3052FF950.pdf; Supplier: LCSC; Convert to PCB: yes; Number of Rows: 双排; Number of Pins: 46; Row Spacing: 2.54mm; Mounting Type: 弯插; Length of Mating Pin: 6mm; Insulation Height: 2.5mm; Length of End Connection Pin: -; Contact Material: 黄铜; Contact Plating: 金; Operating Temperature Range: -40℃~+105℃; Color: 黑色
JP25 = Header 2X2: Header, 2-Pin, Dual row; LatestRevisionDate: 17-Jul-2002; LatestRevisionNote: Re-released for DXP Platform.; Publisher: Altium Limited
JP26 = Header 3_1: 3P接插件; 版权归属: 源创客; BOM名称: 3P接插件; 学习资源: www.ooocke.com
L1 = L 1206: 小功率贴片电感; 版权归属: 源创客; BOM名称: 小功率贴片电感; 学习资源: www.ooocke.com
L2 L3 = CBW160808U000T: 磁珠; Manufacturer: FH(风华); Add into BOM: yes; Tolerance: 0~15Ω; DC Resistance: 80mΩ; Current Rating: 1A; Circuits: 1; Name: CBW160808U000T; Symbol: CBW160808U000T; Device: CBW160808U000T; LCSC Part Name: 0Ω@100MHz 0~15Ω; Supplier Part: C139173; Manufacturer Part: CBW160808U000T; Supplier Footprint: 0603; JLCPCB Part Class: Extended Part; Datasheet: https://atta.szlcsc.com/upload/public/pdf/source/20171102/C139173_15096094127801078754.pdf; Supplier: LCSC; Convert to PCB: yes; Impedance @ Frequency: 0Ω@100MHz
X2 = Passive Oscillator: Manufacturer: YXC(扬兴晶振); Name: 4.096MHz; Symbol: X49SD4096MSD2SC-1; Add into BOM: yes; Crystal Type: 49S晶振; Value: 4.096MHz; Frequency Tolerance: ±20ppm; Frequency Stability: ±30ppm; Load Capacitance: 20pF; Device: X49SD4096MSD2SC-1; LCSC Part Name: HC-49US 4.096MHz ±20ppm 20pF; Supplier Part: C2226; Manufacturer Part: X49SD4096MSD2SC-1; Supplier Footprint: HC-49S; JLCPCB Part Class: Extended Part; Datasheet: https://atta.szlcsc.com/upload/public/pdf/source/20210903/A997D130AE99CBB55D9024F9BE6DA174.pdf; Supplier: LCSC; Convert to PCB: yes; Operating Temperature: -20℃~+70℃

## Nets that join several sheets
+3.3V: ads1299_main (JP11.3), ads1299_Regulators (C49.2 JP13.1 U5.5)
+5V: ads1299_Regulators (15 pins), ads1299_Interface (C0-1.2 C0-2.2 L1.2)
AGND: ads1299_main (26 pins), ads1299_Regulators (30 pins), ads1299_Ain (20 pins), ads1299_Interface (C0-1.1 C0-2.1 L2.2 L3.1)
AVDD: ads1299_main (25 pins), ads1299_Regulators (C0-7.2 C23.2 L4.1 R21.2)
AVSS: ads1299_main (34 pins), ads1299_Regulators (C23.1 D2.K JP14.2)
DVDD: ads1299_main (8 pins), ads1299_Regulators (JP13.2 R48.2), ads1299_Interface (J11.9 J11.12)
BIAS_ELEC: ads1299_main (JP17.1 JP20.3), ads1299_Ain (JP3.2 JP3.4 R62.2)
BIAS_SHD: ads1299_main (U7.1 U7.4), ads1299_Ain (R63.2)
CS#: ads1299_main (R39.2 U1.39), ads1299_Interface (J11.10 J12.33)
DAISY_IN: ads1299_main (U1.41), ads1299_Interface (J11.7 J12.40)
DIN: ads1299_main (U1.34), ads1299_Interface (J11.15 J12.31)
DOUT: ads1299_main (U1.43), ads1299_Interface (J11.5 J12.29)
DRDY#: ads1299_main (U1.47), ads1299_Interface (J11.1 J12.46)
GPIO1: ads1299_main (U1.42), ads1299_Interface (J11.6 J12.39)
GPIO2: ads1299_main (U1.44), ads1299_Interface (J11.4 J12.42)
GPIO3: ads1299_main (U1.45), ads1299_Interface (J11.3 J12.41 JP25.1)
GPIO4: ads1299_main (U1.46), ads1299_Interface (J11.2 J12.44 JP25.3)
IN1_N: ads1299_main (U1.15), ads1299_Ain (JP40.2)
IN1_P: ads1299_main (U1.16), ads1299_Ain (JP42.2)
IN2_N: ads1299_main (U1.13), ads1299_Ain (JP36.2)
IN2_P: ads1299_main (U1.14), ads1299_Ain (JP38.2)
IN3_N: ads1299_main (U1.11), ads1299_Ain (JP32.2)
IN3_P: ads1299_main (U1.12), ads1299_Ain (JP34.2)
IN4_N: ads1299_main (U1.9), ads1299_Ain (JP28.2)
IN4_P: ads1299_main (U1.10), ads1299_Ain (JP30.2)
IN5_N: ads1299_main (U1.7), ads1299_Ain (JP39.2)
IN5_P: ads1299_main (U1.8), ads1299_Ain (JP41.2)
IN6_N: ads1299_main (U1.5), ads1299_Ain (JP35.2)
IN6_P: ads1299_main (U1.6), ads1299_Ain (JP37.2)
IN7_N: ads1299_main (U1.3), ads1299_Ain (JP31.2)
IN7_P: ads1299_main (U1.4), ads1299_Ain (JP33.2)
IN8_N: ads1299_main (U1.1), ads1299_Ain (JP27.2)
IN8_P: ads1299_main (U1.2), ads1299_Ain (JP29.2)
PWDN#: ads1299_main (JP10.1 JP10.3 U1.35), ads1299_Interface (J11.14 J12.1)
REF_ELEC: ads1299_main (JP22.3 JP23.3), ads1299_Ain (R17.1)
RESET#: ads1299_main (R36.1 U1.36), ads1299_Interface (J11.13 J12.3)
SCLK: ads1299_main (U1.40), ads1299_Interface (J11.8 J12.27)
SRB1: ads1299_main (C17-2.2 J9.3 R17-1.2), ads1299_Ain (8 pins)
SRB2: ads1299_main (J9.1 JP23.1), ads1299_Ain (8 pins)
START: ads1299_main (U1.38), ads1299_Interface (J11.11 J12.5)